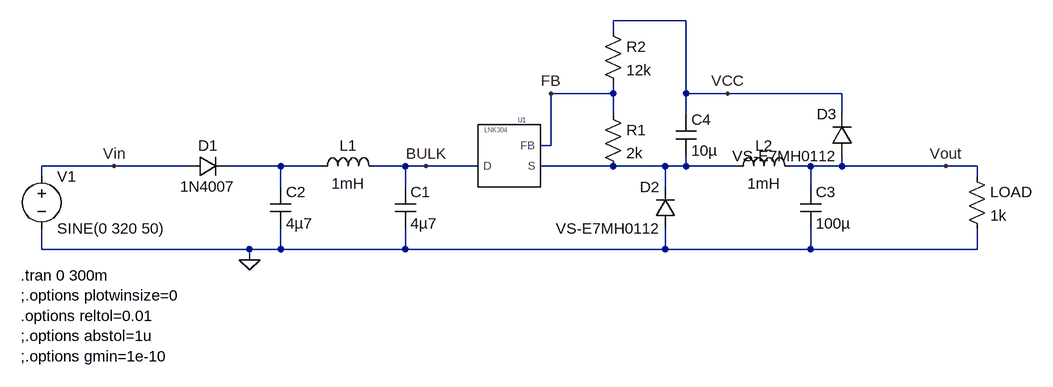
[diagram p0: schematic lnk304.asc]
lnk304.asc, the LTspice schematic file:
Version 4.1
SHEET 1 1000 680
WIRE 464 -64 352 -64
WIRE 352 -48 352 -64
WIRE 352 48 352 32
WIRE 352 48 256 48
WIRE 464 48 464 -64
WIRE 528 48 464 48
WIRE 704 48 528 48
WIRE 352 80 352 48
WIRE 464 80 464 48
WIRE 704 80 704 48
WIRE 256 128 256 48
WIRE 256 128 240 128
WIRE -416 160 -528 160
WIRE -304 160 -416 160
WIRE -160 160 -240 160
WIRE -96 160 -160 160
WIRE 32 160 -16 160
WIRE 64 160 32 160
WIRE 144 160 64 160
WIRE 352 160 240 160
WIRE 432 160 352 160
WIRE 464 160 464 144
WIRE 464 160 432 160
WIRE 544 160 464 160
WIRE 656 160 624 160
WIRE 704 160 704 144
WIRE 704 160 656 160
WIRE 864 160 704 160
WIRE 912 160 864 160
WIRE -528 176 -528 160
WIRE 912 176 912 160
WIRE -160 192 -160 160
WIRE 32 192 32 160
WIRE 432 192 432 160
WIRE 656 192 656 160
WIRE -528 288 -528 256
WIRE -208 288 -528 288
WIRE -160 288 -160 256
WIRE -160 288 -208 288
WIRE 32 288 32 256
WIRE 32 288 -160 288
WIRE 432 288 432 256
WIRE 432 288 32 288
WIRE 656 288 656 256
WIRE 656 288 432 288
WIRE 912 288 912 256
WIRE 912 288 656 288
WIRE -208 304 -208 288
FLAG -208 304 0
FLAG 528 48 VCC
FLAG 256 48 FB
FLAG 864 160 Vout
FLAG -416 160 Vin
FLAG 64 160 BULK
SYMBOL LNK304 192 144 R0
SYMATTR InstName U1
SYMBOL cap 16 192 R0
SYMATTR InstName C1
SYMATTR Value 4µ7
SYMATTR SpiceLine V=400
SYMBOL cap -176 192 R0
SYMATTR InstName C2
SYMATTR Value 4µ7
SYMATTR SpiceLine V=400
SYMBOL ind -112 176 R270
WINDOW 0 32 56 VTop 2
WINDOW 3 5 56 VBottom 2
SYMATTR InstName L1
SYMATTR Value 1mH
SYMBOL diode -304 176 R270
WINDOW 0 32 32 VTop 2
WINDOW 3 0 32 VBottom 2
SYMATTR InstName D1
SYMATTR Value 1N4007
SYMBOL diode 448 256 R180
WINDOW 0 24 64 Left 2
WINDOW 3 24 0 Left 2
SYMATTR InstName D2
SYMATTR Value VS-E7MH0112
SYMBOL voltage -528 160 R0
WINDOW 123 0 0 Left 0
WINDOW 39 0 0 Left 0
SYMATTR InstName V1
SYMATTR Value SINE(0 320 50)
SYMBOL diode 720 144 R180
WINDOW 0 24 64 Left 2
WINDOW 3 24 0 Left 2
SYMATTR InstName D3
SYMATTR Value VS-E7MH0112
SYMBOL cap 640 192 R0
SYMATTR InstName C3
SYMATTR Value 100µ
SYMATTR SpiceLine V=25
SYMBOL ind 528 176 R270
WINDOW 0 32 56 VTop 2
WINDOW 3 5 56 VBottom 2
SYMATTR InstName L2
SYMATTR Value 1mH
SYMBOL cap 448 80 R0
SYMATTR InstName C4
SYMATTR Value 10µ
SYMATTR SpiceLine V=25
SYMBOL res 336 64 R0
SYMATTR InstName R1
SYMATTR Value 2k
SYMBOL res 336 -64 R0
SYMATTR InstName R2
SYMATTR Value 12k
SYMBOL res 896 160 R0
SYMATTR InstName LOAD
SYMATTR Value 1k
TEXT -560 328 Left 2 !.tran 0 300m\n;.options plotwinsize=0\n.options reltol=0.01\n;.options abstol=1u\n;.options gmin=1e-10

The netlist it stands for:
* lnk304.asc
X§U1 BULK FB N002 LNK304  ; pins D FB S
C1 BULK 0 4µ7 V=400
C2 N001 0 4µ7 V=400
L1 N001 BULK 1mH
D1 Vin N001 1N4007
D2 0 N002 VS-E7MH0112
V1 Vin 0 SINE(0 320 50)
D3 Vout VCC VS-E7MH0112
C3 Vout 0 100µ V=25
L2 N002 Vout 1mH
C4 VCC N002 10µ V=25
R1 FB N002 2k
R2 VCC FB 12k
R§LOAD Vout 0 1k
.model D D
.lib standard.dio
.tran 0 300m
;.options plotwinsize=0
.options reltol=0.01
;.options abstol=1u
;.options gmin=1e-10
.lib LNK304.sub
.backanno
.end